# Altium schematic sheet stm32f407.SchDoc
size 599 x 241 mm; SheetNumber: 2; SheetTotal: 4
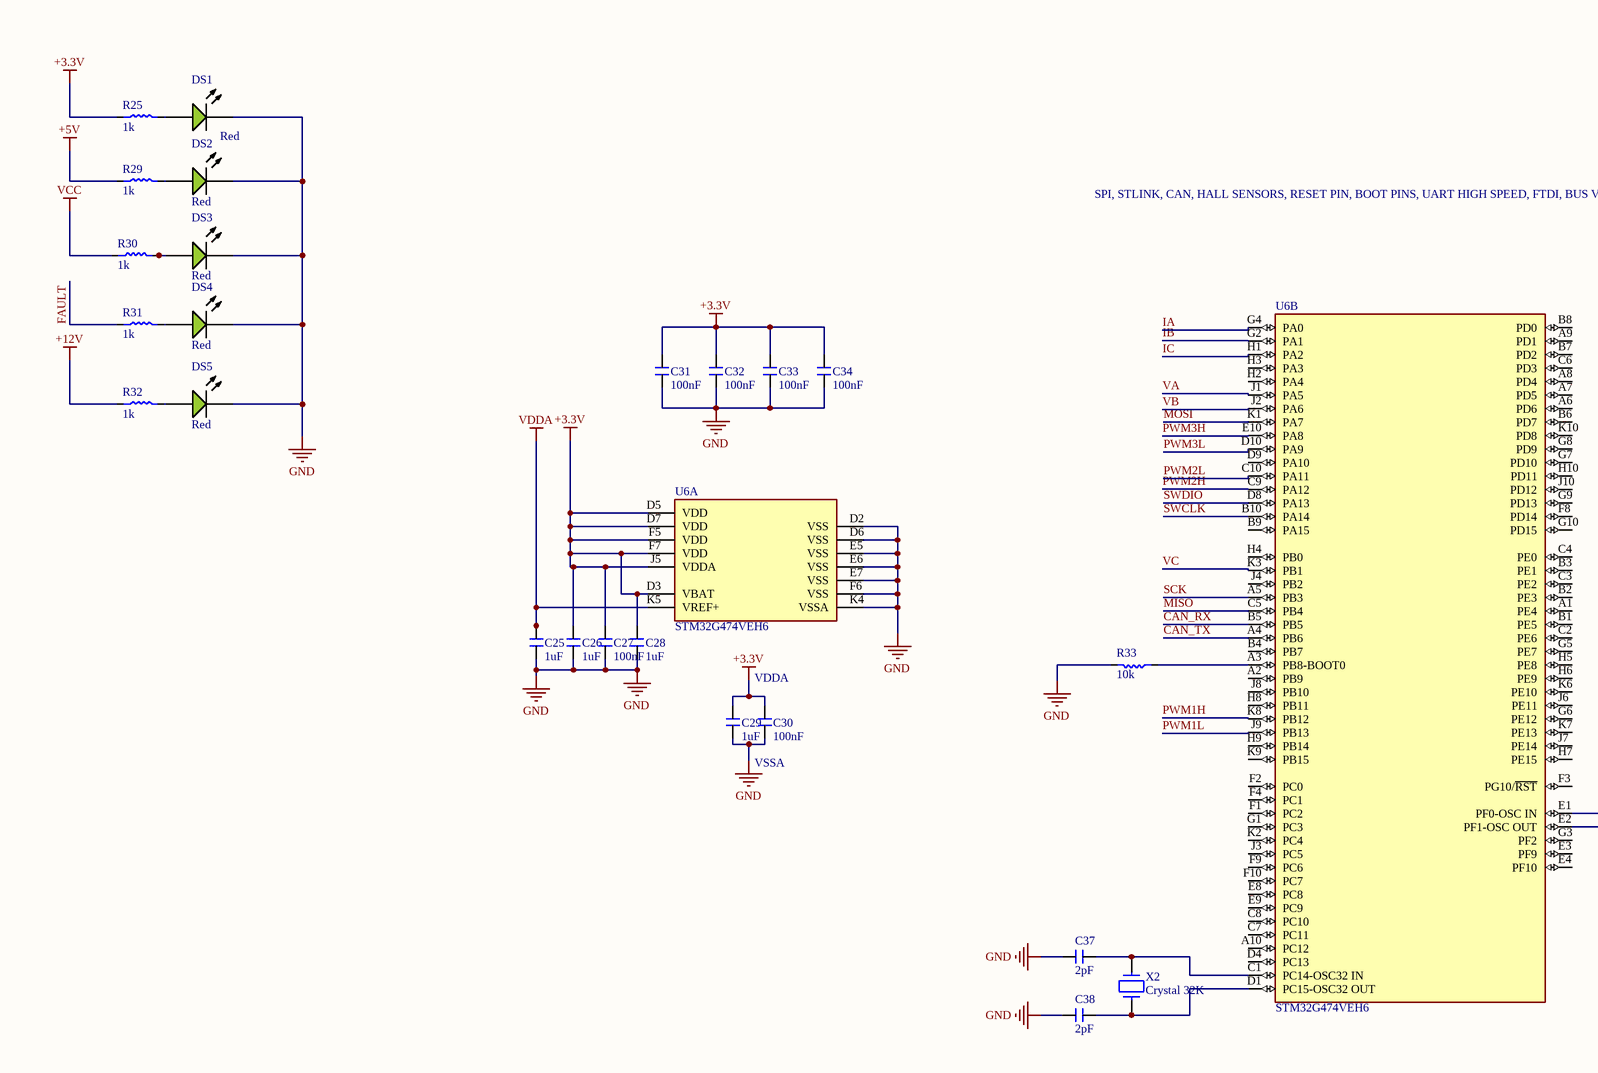
[diagram p0: stm32f407.SchDoc, left]
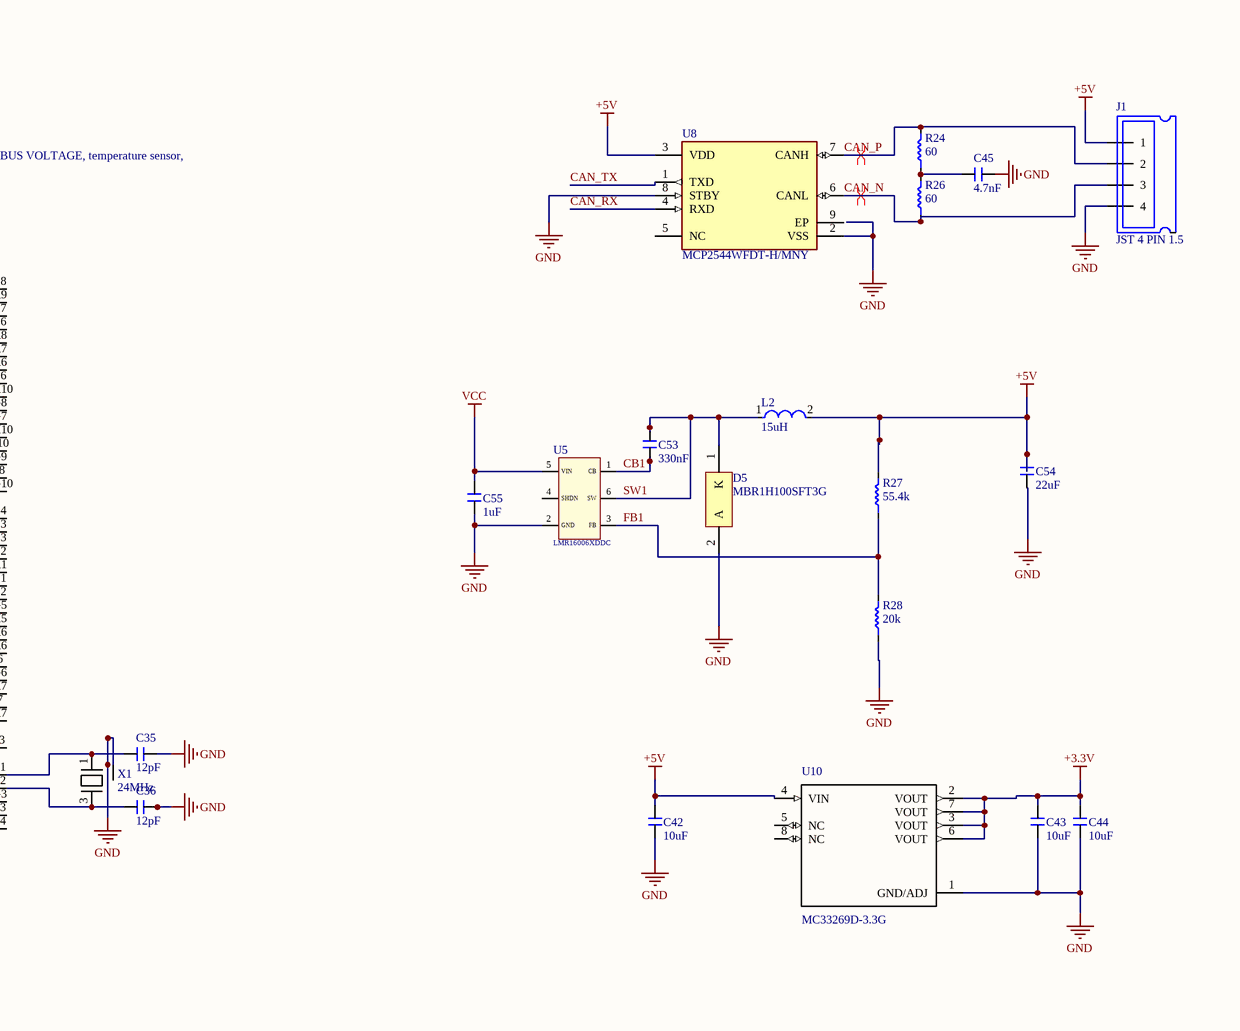
[diagram p1: stm32f407.SchDoc, right]

## Parts
C25  1uF  [C_0402]
C26  1uF  [C_0402]
C27  100nF  [C_0402]
C28  1uF  [C_0402]
C29  1uF  [C_0402]
C30  100nF  [C_0402]
C31  100nF  [C_0402]
C32  100nF  [C_0402]
C33  100nF  [C_0402]
C34  100nF  [C_0402]
C35  12pF  [C_0402]
C36  12pF  [C_0402]
C37  2pF  [C_0402]
C38  2pF  [C_0402]
C42  10uF  [C_0805]
C43  10uF  [C_0805]
C44  10uF  [C_0805]
C45  4.7nF  [C_0402]
C53  330nF  [C_0402]
C54  22uF  [C_0402]
C55  1uF  [C_0402]
D5  MBR1H100SFT3G  [ONSC-SOD-123FL-2-498-01_V]
DS1  Red  [EVRL-0603-2_V]
DS2  Red  [EVRL-0603-2_V]
DS3  Red  [EVRL-0603-2_V]
DS4  Red  [EVRL-0603-2_V]
DS5  Red  [EVRL-0603-2_V]
J1  JST 4 PIN 1.5  [JST 4 PIN 1.5]
L2  15uH  [FP-IHLP-2020CZ-FP_1_905x2-MFG]
R24  60  [R_0402]
R25  1k  [R_0402]
R26  60  [R_0402]
R27  55.4k  [R_0402]
R28  20k  [R_0402]
R29  1k  [R_0402]
R30  1k  [R_0402]
R31  1k  [R_0402]
R32  1k  [R_0402]
R33  10k  [R_0402]
U5  LMR16006XDDC  [SOT95P280X110-6N]  (value not drawn)
U6  STM32G474VEH6  [FP-TFBGA100-A08Q-MFG]  (parts A,B of 2)
U8  MCP2544WFDT-H/MNY  [FP-C04-129-MNY-MFG]
U10  MC33269D-3.3G  [*SOIC127P600X175-8N]
X1  24MHz  [24MHz Crystal]
X2  Crystal 32K  [Crystal 32k]

## Nets
+3.3V: C26.1 C27.2 C28.2 C29.1 C30.2 C31.1 C32.1 C33.1 C34.1 C43.1 C44.1 R25.2 U6.D3(VBAT) U6.D5(VDD) U6.D7(VDD) U6.F5(VDD) U6.F7(VDD) U6.J5(VDDA) U10.2(VOUT) U10.3(VOUT) U10.6(VOUT) U10.7(VOUT)
+5V: C42.1 C54.1 J1.1 L2.2 R27.1 R29.2 U8.3(VDD) U10.4(VIN)
+12V: R32.2
GND: C25.2 C26.2 C27.1 C28.1 C29.2 C30.1 C31.2 C32.2 C33.2 C34.2 C35.2 C36.1 C37.2 C38.1 C42.2 C43.2 C44.2 C45.2 C54.2 C55.2 D5.2(A) DS1.2(K) DS2.2(K) DS3.2(K) DS4.2(K) DS5.2(K) J1.4 R28.2 R33.1 U5.2(GND) U6.D2(VSS) U6.D6(VSS) U6.E5(VSS) U6.E6(VSS) U6.E7(VSS) U6.F6(VSS) U6.K4(VSSA) U8.2(VSS) U8.8(STBY) U10.1(GND/ADJ) X1.2 X1.4
VCC: C55.1 R30.2 U5.5(VIN)
VDDA: C25.1 U6.K5(VREF+)
CAN_N: J1.3 R26.2 U8.6(CANL)
CAN_P: J1.2 R24.1 U8.7(CANH)
CAN_RX: U6.B5(PB5) U8.4(RXD)
CAN_TX: U6.A4(PB6) U8.1(TXD)
CB1: C53.2 U5.1(CB)
FAULT: R31.2
FB1: R27.2 R28.1 U5.3(FB)
IA: U6.G4(PA0)
IB: U6.G2(PA1)
IC: U6.H1(PA2)
MISO: U6.C5(PB4)
MOSI: U6.K1(PA7)
PWM1H: U6.K8(PB12)
PWM1L: U6.J9(PB13)
PWM2H: U6.C9(PA12)
PWM2L: U6.C10(PA11)
PWM3H: U6.E10(PA8)
PWM3L: U6.D10(PA9)
SCK: U6.A5(PB3)
SW1: C53.1 D5.1(K) L2.1 U5.6(SW)
SWCLK: U6.B10(PA14)
SWDIO: U6.D8(PA13)
VA: U6.J1(PA5)
VB: U6.J2(PA6)
VC: U6.K3(PB1)
NetC35_1: C35.1 U6.E1(PF0-OSC_IN) X1.1
NetC36_2: C36.2 U6.E2(PF1-OSC_OUT) X1.3
NetC37_1: C37.1 U6.C1(PC14-OSC32_IN) X2.2
NetC38_2: C38.2 U6.D1(PC15-OSC32_OUT) X2.1
NetC45_1: C45.1 R24.2 R26.1
NetDS1_1: DS1.1(A) R25.1
NetDS2_1: DS2.1(A) R29.1
NetDS3_1: DS3.1(A) R30.1
NetDS4_1: DS4.1(A) R31.1
NetDS5_1: DS5.1(A) R32.1
NetR33_2: R33.2 U6.A3(PB8-BOOT0)

Not connected (* = marked no-connect by the designer): U5 4(SHDN); U6 A1(PE4) A2(PB9) A6(PD6) A7(PD5) A8(PD4) A9(PD1) A10(PC12) B1(PE5) B2(PE3) B3(PE1) B4(PB7) B6(PD7) B7(PD2) B8(PD0) B9(PA15) C2(PE6) C3(PE2) C4(PE0) C6(PD3) C7(PC11) C8(PC10) D4(PC13) D9(PA10) E3(PF9) E4(PF10) E8(PC8) E9(PC9) F1(PC2) F2(PC0) F3(PG10/~{RST}) F4(PC1) F8(PD14) F9(PC6) F10(PC7) G1(PC3) G3(PF2) G5(PE7) G6(PE12) G7(PD10) G8(PD9) G9(PD13) G10(PD15) H2(PA4) H3(PA3) H4(PB0) H5(PE8) H6(PE9) H7(PE15) H8(PB11) H9(PB14) H10(PD11) J3(PC5) J4(PB2) J6(PE11) J7(PE14) J8(PB10) J10(PD12) K2(PC4) K6(PE10) K7(PE13) K9(PB15) K10(PD8); U8 5(NC) 9(EP); U10 5(NC) 8(NC)

## Layout directives
differential pair: CAN_N, CAN_P

## Notes on the sheet
- SPI, STLINK, CAN, HALL SENSORS, RESET PIN, BOOT PINS, UART HIGH SPEED, FTDI, BUS VOLTAGE, temperature sensor,
- VDDA
- VSSA

## Library data of the parts
C25-C38 C45 C53-C55 = C_0402
C42-C44 = C_0805: Manufacturer Part No: *; JLCPCB Part No: *
D5 = CMP-1055-00439-1: Schottky Power Rectifier, 2-Pin SOD-123, Pb-Free, Tape and Reel; Manufacturer: On Semiconductor; IFSM Max (A): 50; Configuration: Single; Mounting Technology: Surface Mount; ComponentLink2Description: Datasheet; ComponentLink3Description: Package Specification; Packing: Tape and Reel; RoHS: TRUE; PartNumber: MBR1H100SFT3G; PackageDescription: 2-Pin SOD, Body 1.65 x 2.7 mm; ComponentLink1Description: Manufacturer URL; ComponentLink2URL: http://www.onsemi.cn/pub_link/Collateral/MBR1H100SF-D.PDF; ComponentLink3URL: http://www.onsemi.cn/pub_link/Collateral/MBR120VLSFT1-D.PDF; PackageVersion: Rev. A; DatasheetVersion: Rev. 1; ComponentLink1URL: http://www.onsemi.com/; PackageReference: SOD-123FL-2-498-01
DS1 = CMP-007-00002-2: Chip LED, Yellow-Green, 5 V, 25 mA, -40 to 85 degC, 2-Pin SMD (0603), RoHS, Tape and Reel; Manufacturer: Everlight Electronics; Forward Voltage: 2V; Lens Style: Clear; Viewing Angle: 120degrees; Colour: Green; Parameter 1: XL-1608SURC-06; Parameter 2: C965799; Mounting Technology: SM; Datasheet Version: Rev. 1, 04/2006; Package Description: 2-Pin Surface Mount Device, Body 1.6 x 0.8 mm; RoHS Compliant: True; Package Reference: 0603; Pins: 2; Manufacturer URL: http://www.everlight.com/; Datasheet URL: https://datasheet.ciiva.com/48679/19-217-g7c-an1p2-3t-48679179.pdf; Case/Package: 0603
DS2-DS5 = CMP-007-00002-2: Chip LED, Yellow-Green, 5 V, 25 mA, -40 to 85 degC, 2-Pin SMD (0603), RoHS, Tape and Reel; Manufacturer: Everlight Electronics; Forward Voltage: 2V; Lens Style: Clear; Viewing Angle: 120degrees; Colour: Green; Mounting Technology: SM; Datasheet Version: Rev. 1, 04/2006; Package Description: 2-Pin Surface Mount Device, Body 1.6 x 0.8 mm; RoHS Compliant: True; Package Reference: 0603; Pins: 2; Manufacturer URL: http://www.everlight.com/; Datasheet URL: https://datasheet.ciiva.com/48679/19-217-g7c-an1p2-3t-48679179.pdf; Case/Package: 0603
L2 = CMP-02424-000144-1: Fixed Inductors Commercial High Saturation Series 15uH 1.9A 265mΩ 20%; Test Frequency: 100kHz; DC Resistance (DCR): 265mR; Saturation Current: 2.5A; Core Material: Metal; Self Resonant Frequency: 5MHz; Shielding: Shielded; Case/Package: 2020; Current Rating: 1.9A; Inductance: 15uH; Height: 3mm; Max Operating Temperature: 125°C; Military Standard: Not; Package Quantity: 2000; Tolerance: 20%; Depth: 5.43mm; Packaging: Tape and Reel; Lead Free: Lead Free; Min Operating Temperature: -55°C; Radiation Hardening: No; Mount: Surface Mount; Height - Seated (Max): 0.118inch; Length: 5.49mm; Width: 0.204inch; Termination: SMD/SMT; Max DC Current: 2.5A
R24-R33 = R_0402
U6 = CMP-12105-000111-1: IC MCU 32BIT 512KB FLSH 100TFBGA; RoHS Compliant: Yes
U8 = CMP-06279-000053-1: IC TRANSCEIVER 1/1 8TDFN; Data Rate: 8Mbps; Receiver Hysteresis: 200mV; RoHS Compliant: Yes; Packaging: Cut Tape; Max Operating Temperature: 150°C; Min Operating Temperature: -40°C; Series: -; Mount: Surface Mount
X1 = 24MHz Crystal
U10 = MC33269D-3.3G: SnapEDA_Link: https://www.snapeda.com/parts/MC33269D-3.3G/Onsemi/view-part/?ref=snap; Check_prices: https://www.snapeda.com/parts/MC33269D-3.3G/Onsemi/view-part/?ref=eda; Value: *